# Altium project RK3566_.PrjPcb (part 1 of 6)
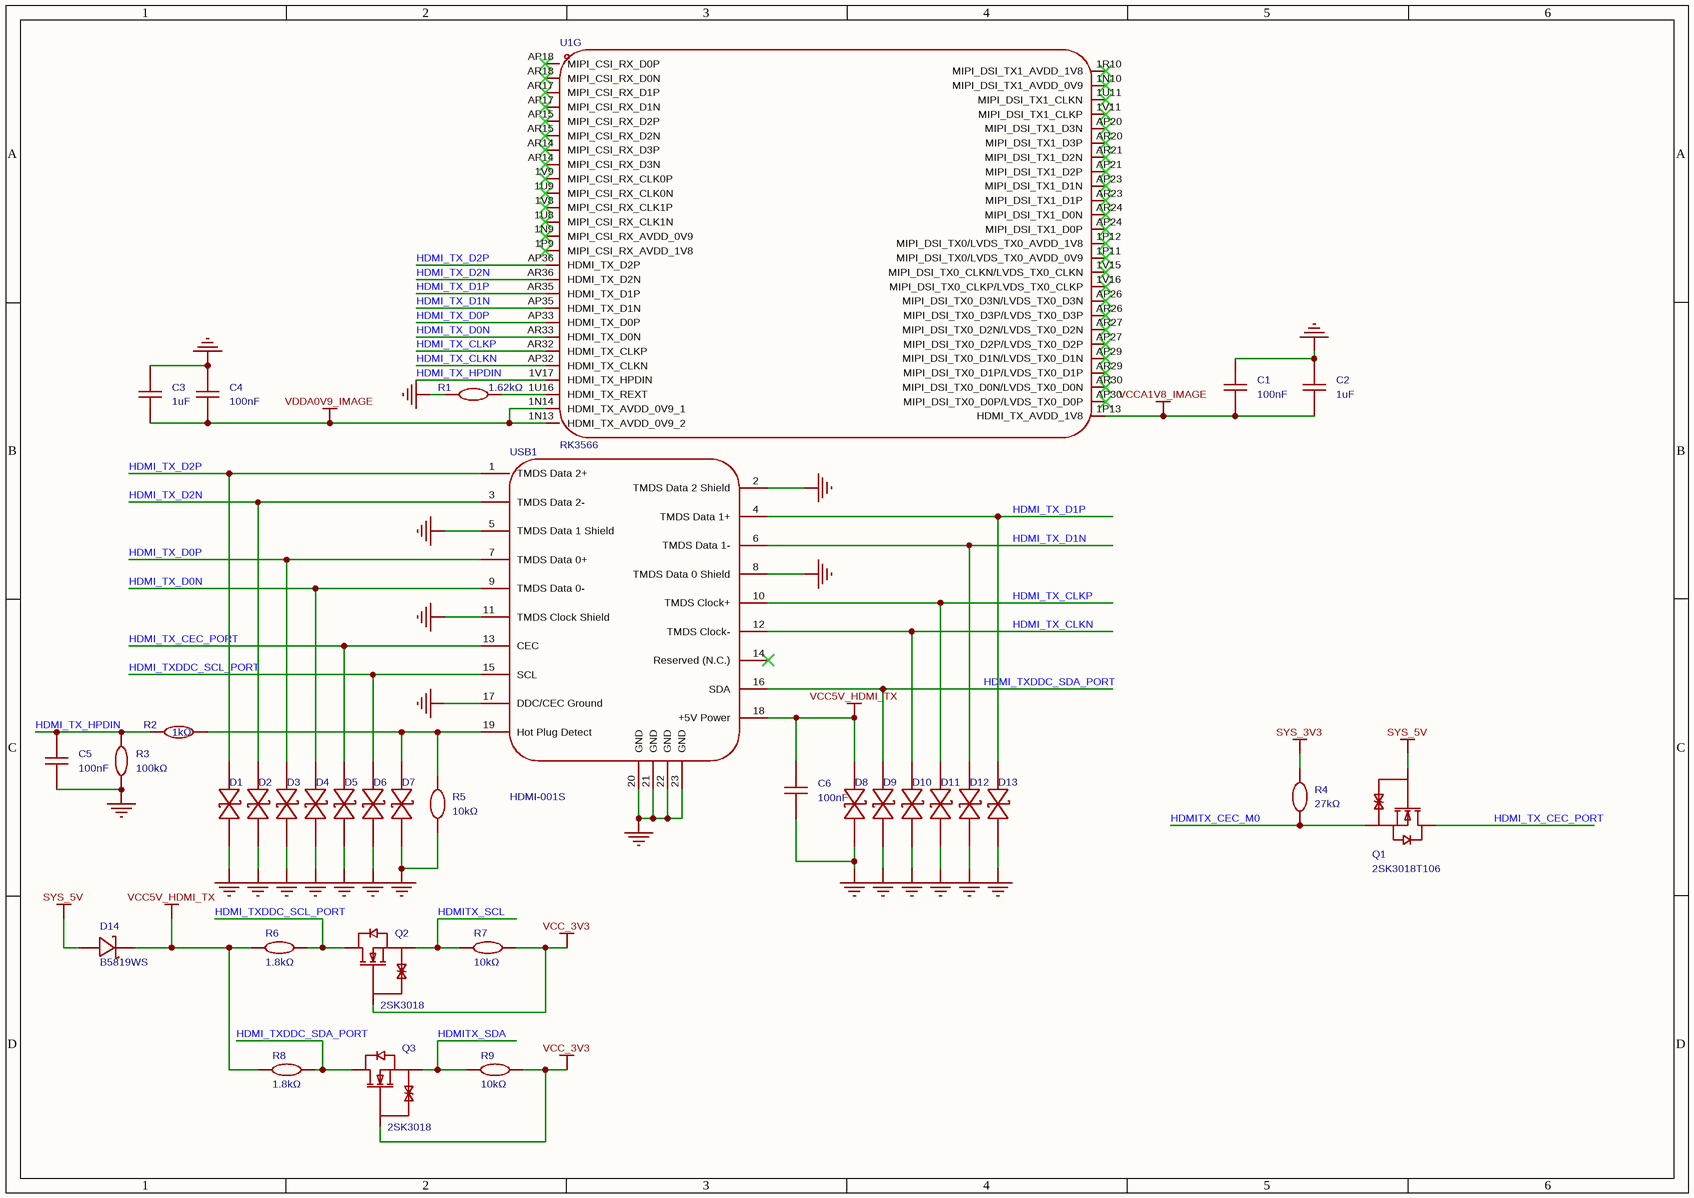
[diagram p0: HDMI PHY _ IO1.schdoc]
11 sheets, 411 parts. Net scope: global (net labels, ports and power ports of the same name join across sheets).
Board file: PCB1.pcbdoc
Sheets:
  HDMI PHY _ IO1.schdoc
  LPDDR4X PHY_IO.schdoc
  PMUIO _ VCCIO.schdoc
  SD卡 PHY.schdoc
  USB接口 PHY_IO.schdoc
  WIFI_BT PHY.schdoc
  板载电源.schdoc
  串口 PHY.schdoc
  扬声器_麦克风.schdoc
  以太网 PHY_以太网_WIFIBT IO.schdoc
  引出引脚_螺纹孔.schdoc

## Sheet HDMI PHY _ IO1.schdoc
size 297 x 209 mm; Symbol: Drawing-Symbol_A4; Company: 嘉立创EDA; Version: V1.0; Page Size: A4; @Project Name: RK3566; @Update Date: 2026-06-03; @Create Date: 2026-05-19; Device: Drawing-Symbol_A4; @Board Name: Board1; @Page Name: P2; @Create Time: 03:19:25; @Page Count: 8; @Page No: 8; @Schematic Name: Schematic1; @Update Time: 03:19:25; @Assembly Variant: Basic; Border: 1; Title Block Position: 3; Size: A4; Width: 1170; Height: 825; Region Start: 1; X Region Count: 6; Y Region Count: 4; Blade Width: 10; SheetNumber: 1; SheetTotal: 11

### Parts
C1  100nF  [C0402]
C2  1uF  [C0402]
C3  1uF  [C0402]
C4  100nF  [C0402]
C5  100nF  [C0402]
C6  100nF  [C0402]
D1  BDFN1C051R  [DFN0603-D_L0.6-W0.3-P0.34-BI]  (value not drawn)
D2  BDFN1C051R  [DFN0603-D_L0.6-W0.3-P0.34-BI]  (value not drawn)
D3  BDFN1C051R  [DFN0603-D_L0.6-W0.3-P0.34-BI]  (value not drawn)
D4  BDFN1C051R  [DFN0603-D_L0.6-W0.3-P0.34-BI]  (value not drawn)
D5  BDFN1C051R  [DFN0603-D_L0.6-W0.3-P0.34-BI]  (value not drawn)
D6  BDFN1C051R  [DFN0603-D_L0.6-W0.3-P0.34-BI]  (value not drawn)
D7  BDFN1C051R  [DFN0603-D_L0.6-W0.3-P0.34-BI]  (value not drawn)
D8  BDFN1C051R  [DFN0603-D_L0.6-W0.3-P0.34-BI]  (value not drawn)
D9  BDFN1C051R  [DFN0603-D_L0.6-W0.3-P0.34-BI]  (value not drawn)
D10  BDFN1C051R  [DFN0603-D_L0.6-W0.3-P0.34-BI]  (value not drawn)
D11  BDFN1C051R  [DFN0603-D_L0.6-W0.3-P0.34-BI]  (value not drawn)
D12  BDFN1C051R  [DFN0603-D_L0.6-W0.3-P0.34-BI]  (value not drawn)
D13  BDFN1C051R  [DFN0603-D_L0.6-W0.3-P0.34-BI]  (value not drawn)
D14  B5819WS  [SOD-323_L1.8-W1.3-LS2.5-RD]
Q1  2SK3018T106  [SOT-323_L2.0-W1.3-P1.30-LS2.1-TR]
Q2  2SK3018  [SOT-323-3_L2.0-W1.3-P1.30-LS2.1-BR]
Q3  2SK3018  [SOT-323-3_L2.0-W1.3-P1.30-LS2.1-BR]
R1  1.62kΩ  [R0402]
R2  1kΩ  [R0402]
R3  100kΩ  [R0402]
R4  27kΩ  [R0402]
R5  10kΩ  [R0402]
R6  1.8kΩ  [R0402]
R7  10kΩ  [R0402]
R8  1.8kΩ  [R0402]
R9  10kΩ  [R0402]
U1  RK3566  [BGA-565_L15.5-W14.4-P0.40_RK3566_1]  (part G of 8)
USB1  HDMI-001S  [HDMI-SMD_HDMI-001S]

### Nets
GND: C1.2 C2.2 C3.2 C4.2 C5.2 C6.2 D1.1 D2.1 D3.1 D4.1 D5.1 D6.1 D7.1 D8.1 D9.1 D10.1 D11.1 D12.1 D13.1 R1.2 R3.1 R5.1 USB1.2(TMDS_Data_2_Shield) USB1.5(TMDS_Data_1_Shield) USB1.8(TMDS_Data_0_Shield) USB1.11(TMDS_Clock_Shield) USB1.17(DDC/CEC_Ground) USB1.20(GND) USB1.21(GND) USB1.22(GND) USB1.23(GND)  [project net AVSS1_1]
SYS_3V3: R4.2
SYS_5V: D14.2(A) Q1.2(G)
VCC5V_HDMI_TX: C6.1 D8.2 D14.1(K) R6.1 R8.1 USB1.18(+5V_Power)
VCC_3V3: Q2.1(G) Q3.1(G) R7.1 R9.1  [project net SWOUT1]
VCCA1V8_IMAGE: C1.1 C2.1 U1.1P13(HDMI_TX_AVDD_1V8)  [project net LDO9]
VDDA0V9_IMAGE: C3.1 C4.1 U1.1N13(HDMI_TX_AVDD_0V9_2) U1.1N14(HDMI_TX_AVDD_0V9_1)  [project net LDO1]
HDMI_TX_CEC_PORT: D5.2 Q1.3(D) USB1.13(CEC)
HDMI_TX_CLKN: D10.2 U1.AP32(HDMI_TX_CLKN) USB1.12(TMDS_Clock-)
HDMI_TX_CLKP: D11.2 U1.AR32(HDMI_TX_CLKP) USB1.10(TMDS_Clock+)
HDMI_TX_D0N: D4.2 U1.AR33(HDMI_TX_D0N) USB1.9(TMDS_Data_0-)
HDMI_TX_D0P: D3.2 U1.AP33(HDMI_TX_D0P) USB1.7(TMDS_Data_0+)
HDMI_TX_D1N: D12.2 U1.AP35(HDMI_TX_D1N) USB1.6(TMDS_Data_1-)
HDMI_TX_D1P: D13.2 U1.AR35(HDMI_TX_D1P) USB1.4(TMDS_Data_1+)
HDMI_TX_D2N: D2.2 U1.AR36(HDMI_TX_D2N) USB1.3(TMDS_Data_2-)
HDMI_TX_D2P: D1.2 U1.AP36(HDMI_TX_D2P) USB1.1(TMDS_Data_2+)
HDMI_TX_HPDIN: C5.1 R2.2 R3.2 U1.1V17(HDMI_TX_HPDIN)
HDMI_TXDDC_SCL_PORT: D6.2 Q2.3(D) R6.2 USB1.15(SCL)
HDMI_TXDDC_SDA_PORT: D9.2 Q3.3(D) R8.2 USB1.16(SDA)
HDMITX_CEC_M0: Q1.1(S) R4.1
HDMITX_SCL: Q2.2(S) R7.2
HDMITX_SDA: Q3.2(S) R9.2
NetD7_2: D7.2 R2.1 R5.2 USB1.19(Hot_Plug_Detect)
NetR1_1: R1.1 U1.1U16(HDMI_TX_REXT)

Not connected (* = marked no-connect by the designer): U1 1N9(MIPI_CSI_RX_AVDD_0V9)* 1N10(MIPI_DSI_TX1_AVDD_0V9)* 1P9(MIPI_CSI_RX_AVDD_1V8)* 1P11(MIPI_DSI_TX0/LVDS_TX0_AVDD_0V9)* 1P12(MIPI_DSI_TX0/LVDS_TX0_AVDD_1V8)* 1R10(MIPI_DSI_TX1_AVDD_1V8)* 1U8(MIPI_CSI_RX_CLK1N)* 1U9(MIPI_CSI_RX_CLK0N)* 1U11(MIPI_DSI_TX1_CLKN)* 1V8(MIPI_CSI_RX_CLK1P)* 1V9(MIPI_CSI_RX_CLK0P)* 1V11(MIPI_DSI_TX1_CLKP)* 1V15(MIPI_DSI_TX0_CLKN/LVDS_TX0_CLKN)* 1V16(MIPI_DSI_TX0_CLKP/LVDS_TX0_CLKP)* AP14(MIPI_CSI_RX_D3N)* AP15(MIPI_CSI_RX_D2P)* AP17(MIPI_CSI_RX_D1N)* AP18(MIPI_CSI_RX_D0P)* AP20(MIPI_DSI_TX1_D3N)* AP21(MIPI_DSI_TX1_D2P)* AP23(MIPI_DSI_TX1_D1N)* AP24(MIPI_DSI_TX1_D0P)* AP26(MIPI_DSI_TX0_D3N/LVDS_TX0_D3N)* AP27(MIPI_DSI_TX0_D2P/LVDS_TX0_D2P)* AP29(MIPI_DSI_TX0_D1N/LVDS_TX0_D1N)* AP30(MIPI_DSI_TX0_D0P/LVDS_TX0_D0P)* AR14(MIPI_CSI_RX_D3P)* AR15(MIPI_CSI_RX_D2N)* AR17(MIPI_CSI_RX_D1P)* AR18(MIPI_CSI_RX_D0N)* AR20(MIPI_DSI_TX1_D3P)* AR21(MIPI_DSI_TX1_D2N)* AR23(MIPI_DSI_TX1_D1P)* AR24(MIPI_DSI_TX1_D0N)* AR26(MIPI_DSI_TX0_D3P/LVDS_TX0_D3P)* AR27(MIPI_DSI_TX0_D2N/LVDS_TX0_D2N)* AR29(MIPI_DSI_TX0_D1P/LVDS_TX0_D1P)* AR30(MIPI_DSI_TX0_D0N/LVDS_TX0_D0N)*; USB1 14(Reserved_(N.C.))*

### Notes on the sheet
- 创建日期
- 2026-10-04
- 原理图
- 板子
- Schematic1
- Board1
- 更新日期
- 图页
- P2
- 绘制
- 审阅
- RK3566
- 版本
- V1.0
- 尺寸
- A4
- 页    8    共    8
- 嘉立创EDA

### Library data of the parts
C1 C4-C6 = CL05B104KO5NNNC: 容值:100nF;精度:±10%;额定电压:16V;温度系数:X7R;; Manufacturer: SAMSUNG(三星); 3D Model: 36a51122f27c49738f86b3bfa98863e0聨0819f05c4eef4c71ace90d822a990e87; 3D Model Transform: 39.37,19.685,0,0,0,0,0,0,0; Tolerance: ±10%; Voltage Rating: 16V; Temperature Coefficient: X7R; AddInBom: yes; ModelName: C0402_L1.0-W0.5-H0.5; Symbol: CL05B104KO5NNNC; Device: CL05B104KO5NNNC; LCSC Part Name: 100nF ±10% 16V; Supplier Part: C1525; Manufacturer Part: CL05B104KO5NNNC; Supplier Footprint: 0402; JLCPCB Part Class: Basic Part; Datasheet: https://item.szlcsc.com/datasheet/CL05B104KO5NNNC/1877.html; Supplier: LCSC; Value: 100nF; ConvertToPcb: yes; FootprintName: C0402
C2 C3 = HGC0402R5105K500NTEJ: 容值:1uF;精度:±10%;额定电压:50V;温度系数:X5R;; Manufacturer: Chinocera(华瓷); 3D Model: 36a51122f27c49738f86b3bfa98863e0聨0819f05c4eef4c71ace90d822a990e87; 3D Model Transform: 39.37,19.685,0,0,0,0,0,0,0; Tolerance: ±10%; Voltage Rating: 50V; Temperature Coefficient: X5R; AddInBom: yes; ModelName: C0402_L1.0-W0.5-H0.5; Symbol: HGC0402R5105K500NTEJ; Device: HGC0402R5105K500NTEJ; LCSC Part Name: 1uF ±10% 50V; Supplier Part: C7472948; Manufacturer Part: HGC0402R5105K500NTEJ; Supplier Footprint: 0402; JLCPCB Part Class: Extended Part; Datasheet: https://item.szlcsc.com/datasheet/HGC0402R5105K500NTEJ/8532795.html; Supplier: LCSC; Value: 1uF; ConvertToPcb: yes; FootprintName: C0402
D1-D13 = BDFN1C051R: 极性:双向;反向截止电压(Vrwm):5V;钳位电压:13V;峰值脉冲电流(Ipp):4A@8/20us;击穿电压(VBR):5.5V;; Manufacturer: BORN(伯恩半导体); AddInBom: yes; ModelId: 295ccb0e91f84fca9fcc42e8f031306b聨0819f05c4eef4c71ace90d822a990e87; ModelName: DFN0603-D_L0.6-W0.3--H0.3-P0.34-BI; ModelTransform: 24.0157,12.2047,0,0,0,0,0,0,0; Polarity: 双向; Reverse Stand-Off Voltage (Vrwm): 5V; Clamping Voltage: 13V; Voltage - Breakdown: 5.5V; Reverse Leakage Current (Ir): 100nA; Number of Channels: 单路; level of protection: IEC 61000-4-4；IEC 61000-4-5；IEC 61000-4-2; Type: ESD; Junction Capacitance: 0.2pF; Symbol: BDFN1C051R; Device: BDFN1C051R; LCSC Part Name: 双向ESD 5V截止 峰值脉冲电流：4A@8/20us; SupplierPart: C152032; ManufacturerPart: BDFN1C051R; Supplier Footprint: DFN0603-D; JLCPCB Part Class: Extended Part; Datasheet: https://item.szlcsc.com/datasheet/BDFN1C051R/163372.html; Supplier: LCSC; ConvertToPcb: yes; FootprintName: DFN0603-D_L0.6-W0.3-P0.34-BI; Peak Pulse Current (Ipp): 4A@8/20us
D14 = B5819WS_C22624: 直流反向耐压(Vr):40V;平均整流电流(Io):1A;正向压降(Vf):600mV@1A;; Manufacturer: CJ(江苏长电/长晶); 3D Model: e9dd044ee7bf4221b3b795eb56bce7c0; 3D Model Transform: 98.91933,51.181,0,180,0,0,0.985,-0.0005,0; Reverse Voltage (Vr): 40V; Average Rectified Current (Io): 1A; AddInBom: yes; ModelName: SOD-323_L1.7-W1.3-H1.1-LS2.5; Symbol: B5819WS_C22624; Device: B5819WS_C22624; LCSC Part Name: 40V 1A 600mV@1A; Supplier Part: C22624; Manufacturer Part: B5819WS; Supplier Footprint: SOD-323; JLCPCB Part Class: Extended Part; Datasheet: https://atta.szlcsc.com/upload/public/pdf/source/20170919/C22624_1505799673448977596.pdf; Supplier: LCSC; Forward Voltage (Vf@If): 600mV@1A; ConvertToPcb: yes; FootprintName: SOD-323_L1.8-W1.3-LS2.5-RD
Q1 = 2SK3018T106: 数量:1个N沟道;漏源电压(Vdss):30V;连续漏极电流(Id):100mA;导通电阻(RDS(on)):13Ω@2.5V;耗散功率(Pd):200mW;阈值电压(Vgs(th)):1.5V;; Manufacturer: ROHM(罗姆); AddInBom: yes; ModelId: 16cdee8f029a4e608a375d4e8ff80303聨0819f05c4eef4c71ace90d822a990e87; ModelTransform: 82.677,78.74,0,0,0,0,0,0,0; Number: 1个N沟道; Drain to Source Voltage: 30V; Current - Continuous Drain(Id): 100mA; Pd - Power Dissipation: 200mW; Gate Threshold Voltage (Vgs(th)): 1.5V; Input Capacitance(Ciss): 13pF; Reverse Transfer Capacitance (Crss@Vds): 4pF; Type: N沟道; Output Capacitance(Coss): 9pF; Vgs: ±20V; Symbol: 2SK3018T106; Device: 2SK3018T106; LCSC Part Name: 1个N沟道 耐压:30V 电流:100mA; SupplierPart: C113315; ManufacturerPart: 2SK3018T106; Supplier Footprint: SOT-323; JLCPCB Part Class: Extended Part; Datasheet: https://item.szlcsc.com/datasheet/2SK3018T106/114550.html; Supplier: LCSC; ConvertToPcb: yes; FootprintName: SOT-323_L2.0-W1.3-P1.30-LS2.1-TR; ModelName: SOT-323_L2.0-W1.3-P1.30-LS2.1-TR; RDS(on): 13Ω@2.5V; Gate Charge(Qg): -; Operating Temperature: -55℃~+150℃; Configuration: -
Q2 Q3 = 2SK3018_C194460: 类型:N沟道;漏源电压(Vdss):30V;连续漏极电流(Id):100mA;功率(Pd):200mW;导通电阻(RDS(on)@Vgs,Id):8Ω@4V,10mA;阈值电压(Vgs(th)@Id):1.5V@100uA;; Manufacturer: CJ(江苏长电/长晶); 3D Model: 59529c0d6fc749f28f2d0659e12986b4; 3D Model Transform: 78.74,82.677,0,90,0,0,0.0005,0,0; Type: N沟道; Drain Source Voltage (Vdss): 30V; Continuous Drain Current (Id): 100mA; Power Dissipation (Pd): 200mW; AddInBom: yes; ModelName: SOT-323-3_L2.0-W1.3-H1.0-LS2.1-P1.30; Symbol: 2SK3018_C194460; Device: 2SK3018_C194460; LCSC Part Name: N沟道 30V 100mA; Supplier Part: C194460; Manufacturer Part: 2SK3018; Supplier Footprint: SOT-323-3; JLCPCB Part Class: Extended Part; Datasheet: https://atta.szlcsc.com/upload/public/pdf/source/20180612/C194460_7DCC01674DB4E554C67F4CC0517F82F1.pdf; Supplier: LCSC; Drain Source On Resistance (RDS(on)@Vgs,Id): 8Ω@4V,10mA; Gate Threshold Voltage (Vgs(th)@Id): 1.5V@100uA; ConvertToPcb: yes; FootprintName: SOT-323-3_L2.0-W1.3-P1.30-LS2.1-BR
R1 = RC0402FR-071K62L: 最大工作电压:50V;工作温度范围:-55℃~+155℃;电阻长:-;精度:±1%;电阻直径:-;电阻高:-;电阻宽:-;电阻类型:厚膜电阻;功率:62.5mW;温度系数:±100ppm/℃;阻值:1.62kΩ;; Manufacturer: YAGEO(国巨); Symbol: RC-02W1621FT; 3D Model: 671aefced39d4c318694bba8bd8efd39; 3D Model Transform: 39.37,19.685,0,0,0,0,0,0.0005,0; Overload Voltage (Max): 50V; Tolerance: ±1%; Power(Watts): 62.5mW; AddInBom: yes; ModelName: R0402_L1.0-W0.5-H0.5; Device: RC0402FR-071K62L; Datasheet: https://atta.szlcsc.com/upload/public/pdf/source/20181114/C321323_9504FB1C8D32FD153B2A6FEF9347E3A6.pdf; LCSC Part Name: 1.62kΩ ±1%; Supplier Part: C138038; Manufacturer Part: RC0402FR-071K62L; Supplier Footprint: 0402; JLCPCB Part Class: Extended Part; Supplier: LCSC; Operating Temperature Range: -55℃~+155℃; Body Length: -; φD: -; Body Height: -; Body Width: -; Type: 厚膜电阻; Temperature Coefficient: ±100ppm/℃; Value: 1.62kΩ; ConvertToPcb: yes; FootprintName: R0402
R2 = 0402WGF1001TCE: 电阻类型:厚膜电阻;阻值:1kΩ;精度:±1%;功率:62.5mW;温度系数:±100ppm/℃;最大工作电压:50V;工作温度范围:-55℃~+155℃;; Manufacturer: UNI-ROYAL(厚声); 3D Model: 671aefced39d4c318694bba8bd8efd39; 3D Model Transform: 39.37,19.685,0,0,0,0,0,0.0005,0; Tolerance: ±1%; Power(Watts): 62.5mW; Overload Voltage (Max): 50V; AddInBom: yes; ModelName: R0402_L1.0-W0.5-H0.5; Symbol: 0402WGF1001TCE; Device: 0402WGF1001TCE; LCSC Part Name: 1kΩ ±1% 62.5mW; Supplier Part: C11702; Manufacturer Part: 0402WGF1001TCE; Supplier Footprint: 0402; JLCPCB Part Class: Basic Part; Datasheet: https://atta.szlcsc.com/upload/public/pdf/source/20200306/C422600_1E6D84923E4A46A82E41ADD87F860B5C.pdf; Supplier: LCSC; Type: 厚膜电阻; Value: 1kΩ; Temperature Coefficient: ±100ppm/℃; Operating Temperature Range: -55℃~+155℃; ConvertToPcb: yes; FootprintName: R0402
R3 = 0402WGF1003TCE: 电阻类型:厚膜电阻;阻值:100kΩ;精度:±1%;功率:62.5mW;温度系数:±100ppm/℃;最大工作电压:50V;工作温度范围:-55℃~+155℃;; Manufacturer: UNI-ROYAL(厚声); 3D Model: 671aefced39d4c318694bba8bd8efd39; 3D Model Transform: 39.37,19.685,0,0,0,0,0,0.0005,0; Tolerance: ±1%; Power(Watts): 62.5mW; Overload Voltage (Max): 50V; AddInBom: yes; ModelName: R0402_L1.0-W0.5-H0.5; Symbol: 0402WGF1003TCE; Device: 0402WGF1003TCE; LCSC Part Name: 100kΩ ±1% 62.5mW; Supplier Part: C25741; Manufacturer Part: 0402WGF1003TCE; Supplier Footprint: 0402; JLCPCB Part Class: Basic Part; Datasheet: https://atta.szlcsc.com/upload/public/pdf/source/20200306/C422600_1E6D84923E4A46A82E41ADD87F860B5C.pdf; Supplier: LCSC; Type: 厚膜电阻; Value: 100kΩ; Temperature Coefficient: ±100ppm/℃; Operating Temperature Range: -55℃~+155℃; Voltage-Supply(Max): 50V; Operating Temperature: -55℃~+155℃; ConvertToPcb: yes; FootprintName: R0402
R4 = FRC0402F2702TS: 电阻类型:厚膜电阻;阻值:27kΩ;精度:±1%;功率:62.5mW;工作电压:50V;温度系数:±100ppm/℃;; Manufacturer: FOJAN(富捷); AddInBom: yes; ModelId: 98c88bc2b9094f218f3a3e30a7012738聨0819f05c4eef4c71ace90d822a990e87; ModelName: R0402_L1.0-W0.5-H0.4; ModelTransform: 39.37,19.685,0,0,0,0,0,0,0; Tolerance: ±1%; Power(Watts): 62.5mW; Voltage-Supply(Max): 50V; Symbol: FRC0402F2702TS; Device: FRC0402F2702TS; LCSC Part Name: 27kΩ ±1% 62.5mW 厚膜电阻; SupplierPart: C2933084; ManufacturerPart: FRC0402F2702TS; Supplier Footprint: 0402; JLCPCB Part Class: Extended Part; Datasheet: https://item.szlcsc.com/datasheet/FRC0402F2702TS/3279186.html; Supplier: LCSC; ConvertToPcb: yes; FootprintName: R0402; Type: 厚膜电阻; Value: 27kΩ; Temperature Coefficient: ±100ppm/℃; Operating Temperature: -55℃~+155℃
R5 = FRC0402F1002TS: 电阻类型:厚膜电阻;阻值:10kΩ;精度:±1%;功率:62.5mW;工作电压:50V;温度系数:±100ppm/℃;; Manufacturer: FOJAN(富捷); 3D Model: 98c88bc2b9094f218f3a3e30a7012738聨0819f05c4eef4c71ace90d822a990e87; 3D Model Transform: 39.37,19.685,0,0,0,0,0,0,0; Tolerance: ±1%; Power(Watts): 62.5mW; Voltage-Supply(Max): 50V; AddInBom: yes; ModelName: R0402_L1.0-W0.5-H0.4; Symbol: FRC0402F1002TS; Device: FRC0402F1002TS; LCSC Part Name: 10kΩ ±1% 62.5mW 厚膜电阻; Supplier Part: C2906861; Manufacturer Part: FRC0402F1002TS; Supplier Footprint: 0402; JLCPCB Part Class: Extended Part; Datasheet: https://item.szlcsc.com/datasheet/FRC0402F1002TS/3180374.html; Supplier: LCSC; Type: 厚膜电阻; Value: 10kΩ; Temperature Coefficient: ±100ppm/℃; Operating Temperature: -55℃~+155℃; ConvertToPcb: yes; FootprintName: R0402
R6 R8 = RC0402FR-071K8L: 电阻类型:厚膜电阻;阻值:1.8kΩ;精度:±1%;功率:62.5mW;温度系数:±100ppm/℃;最大工作电压:50V;工作温度范围:-55℃~+155℃;; Manufacturer: YAGEO(国巨); 3D Model: 671aefced39d4c318694bba8bd8efd39; 3D Model Transform: 39.37,19.685,0,0,0,0,0,0.0005,0; Tolerance: ±1%; Power(Watts): 62.5mW; Overload Voltage (Max): 50V; AddInBom: yes; ModelName: R0402_L1.0-W0.5-H0.5; Symbol: RC0402FR-071K8L; Device: RC0402FR-071K8L; LCSC Part Name: 1.8kΩ ±1% 62.5mW; Supplier Part: C163481; Manufacturer Part: RC0402FR-071K8L; Supplier Footprint: 0402; JLCPCB Part Class: Extended Part; Datasheet: https://atta.szlcsc.com/upload/public/pdf/source/20180111/C163481_15156544709981259002.pdf; Supplier: LCSC; Type: 厚膜电阻; Value: 1.8kΩ; Temperature Coefficient: ±100ppm/℃; Operating Temperature Range: -55℃~+155℃; ConvertToPcb: yes; FootprintName: R0402
R7 R9 = CRCW040210K0FKED: 电阻类型:厚膜电阻;阻值:10kΩ;精度:±1%;功率:63mW;温度系数:±100ppm/K;最大工作电压:50V;工作温度范围:-55℃~+155℃;; Manufacturer: VISHAY(威世); 3D Model: 671aefced39d4c318694bba8bd8efd39; 3D Model Transform: 39.37,19.685,0,0,0,0,0,0.0005,0; Tolerance: ±1%; Power(Watts): 63mW; Overload Voltage (Max): 50V; AddInBom: yes; ModelName: R0402_L1.0-W0.5-H0.5; Symbol: CRCW040210K0FKED; Device: CRCW040210K0FKED; LCSC Part Name: 10kΩ ±1% 63mW; Supplier Part: C71617; Manufacturer Part: CRCW040210K0FKED; Supplier Footprint: 0402; JLCPCB Part Class: 扩展库; Datasheet: https://atta.szlcsc.com/upload/public/pdf/source/20180224/C71617_15194370300791364062.pdf; Supplier: LCSC; Type: 厚膜电阻; Value: 10kΩ; Temperature Coefficient: ±100ppm/K; Operating Temperature Range: -55℃~+155℃; ConvertToPcb: yes; FootprintName: R0402
U1 = RK3566: 是一款高性能、低功耗的四核应用处理器，专为个人移动互联网设备和AIoT设备设计。提供了许多嵌入式强大硬件引擎，以优化高端应用的性能。支持几乎全格式的H.264 4K@60fps解码器、H.265 4K@60fps解码器，还支持H.264/H.265 1080p@60fps编码器、高质量JPEG编码器/解码器。嵌入式3D GPU使其完全兼容OpenGL ES 1.1/2.0/3.2、OpenCL 2.0和Vulkan 1.1; Manufacturer: Rockchip(瑞芯微); Relevance: []; 3D Model: 096be4498db445d8b521581a084e15ec聨0819f05c4eef4c71ace90d822a990e87; 3D Model Transform: 610.235,566.928,0,0,0,0,0,0,0; AddInBom: yes; Symbol: RK3566; Device: RK3566; LCSC Part Name: 表面贴装型开关全行程、动作力等性能; Supplier Part: C2943786; Manufacturer Part: RK3566; Supplier Footprint: BGA-565(15.5x14.4); JLCPCB Part Class: Extended Part; Datasheet: https://item.szlcsc.com/datasheet/RK3566/3329057.html; Supplier: LCSC; ConvertToPcb: yes; FootprintName: BGA-565_L15.5-W14.4-P0.40_RK3566_1; ModelName: BGA-565_L15.5-W14.4-P0.40_RK3566_1
USB1 = HDMI-001S: 19PIN A型前插后贴HDMI插座 铜壳; Manufacturer: XUNPU(讯普); AddInBom: yes; ModelId: 95350f9f774e4f059b8c605506db97f9聨0819f05c4eef4c71ace90d822a990e87; ModelTransform: 590.5878,468.503,0,0,0,0,0,-79.567,-85.039; Connector Type: HDMI-A; Gender: 母; Symbol: HDMI-001S; Device: HDMI-001S; LCSC Part Name: HDMI-A 母 19P; SupplierPart: C720616; ManufacturerPart: HDMI-001S; Supplier Footprint: SMD; JLCPCB Part Class: Extended Part; Datasheet: https://item.szlcsc.com/datasheet/HDMI-001S/763623.html; Supplier: LCSC; ConvertToPcb: yes; FootprintName: HDMI-SMD_HDMI-001S; ModelName: HDMI-SMD_HDMI-001S; Number of Pins: 19P; Mounting Type: 卧贴; Current Rating: -; Voltage Rating: -; Operating Temperature: -

## Sheet LPDDR4X PHY_IO.schdoc
size 420 x 297 mm; Symbol: Drawing-Symbol_A4; Company: 嘉立创EDA; Version: V1.0; Page Size: A4; @Project Name: RK3566; @Update Date: 2026-10-04; @Create Date: 2026-05-19; Device: Drawing-Symbol_A4; @Board Name: Board1; @Page Name: P2; @Create Time: 03:18:35; @Page Count: 6; @Page No: 6; @Schematic Name: Schematic1; @Update Time: 03:18:35; @Assembly Variant: Basic; Border: 1; Title Block Position: 3; Size: A4; Width: 1655; Height: 1170; Region Start: 1; X Region Count: 6; Y Region Count: 4; Blade Width: 10; SheetNumber: 2; SheetTotal: 11
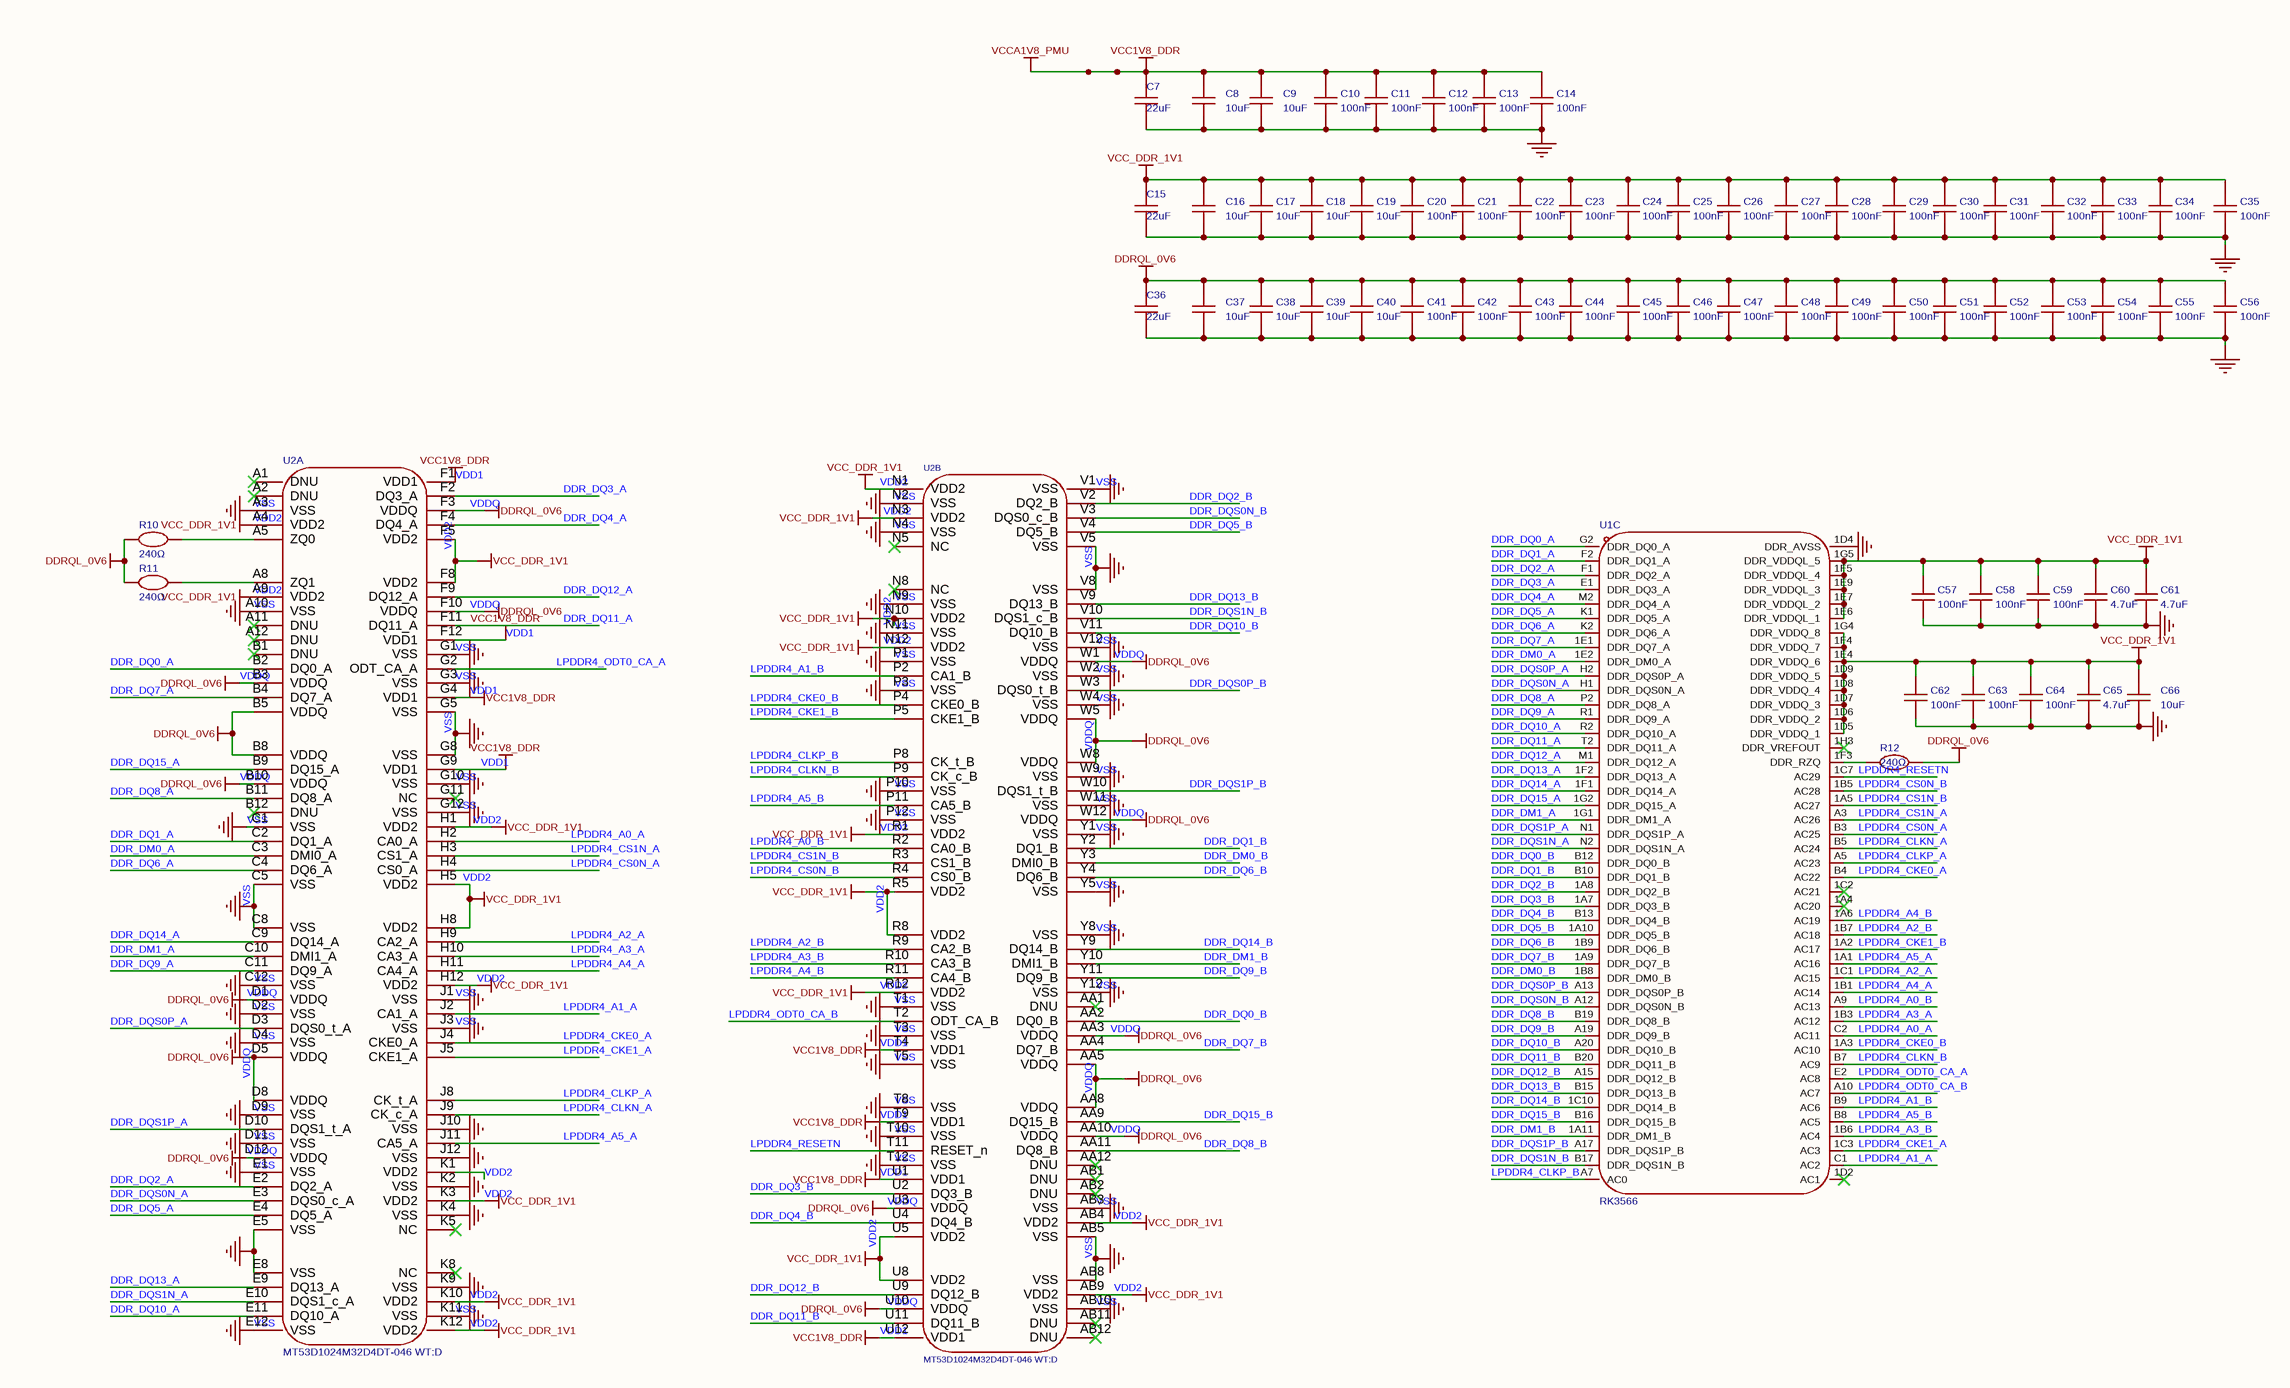
[diagram p1: LPDDR4X PHY_IO.schdoc]

### Parts
C7  22uF  [C0603]
C8  10uF  [C0402]
C9  10uF  [C0402]
C10  100nF  [C0402]
C11  100nF  [C0402]
C12  100nF  [C0402]
C13  100nF  [C0402]
C14  100nF  [C0402]
C15  22uF  [C0603]
C16  10uF  [C0402]
C17  10uF  [C0402]
C18  10uF  [C0402]
C19  10uF  [C0402]
C20  100nF  [C0402]
C21  100nF  [C0402]
C22  100nF  [C0402]
C23  100nF  [C0402]
C24  100nF  [C0402]
C25  100nF  [C0402]
C26  100nF  [C0402]
C27  100nF  [C0402]
C28  100nF  [C0402]
C29  100nF  [C0402]
C30  100nF  [C0402]
C31  100nF  [C0402]
C32  100nF  [C0402]
C33  100nF  [C0402]
C34  100nF  [C0402]
C35  100nF  [C0402]
C36  22uF  [C0603]
C37  10uF  [C0402]
C38  10uF  [C0402]
C39  10uF  [C0402]
C40  10uF  [C0402]
C41  100nF  [C0402]
C42  100nF  [C0402]
C43  100nF  [C0402]
C44  100nF  [C0402]
C45  100nF  [C0402]
C46  100nF  [C0402]
C47  100nF  [C0402]
C48  100nF  [C0402]
C49  100nF  [C0402]
C50  100nF  [C0402]
C51  100nF  [C0402]
C52  100nF  [C0402]
C53  100nF  [C0402]
C54  100nF  [C0402]
C55  100nF  [C0402]
C56  100nF  [C0402]
C57  100nF  [C0201]
C58  100nF  [C0201]
C59  100nF  [C0201]
C60  4.7uF  [C0402]
C61  4.7uF  [C0402]
C62  100nF  [C0201]
C63  100nF  [C0201]
C64  100nF  [C0201]
C65  4.7uF  [C0402]
C66  10uF  [C0603]
R10  240Ω  [R0402]
R11  240Ω  [R0402]
R12  240Ω  [R0402]
U1  RK3566  [BGA-565_L15.5-W14.4-P0.40_RK3566_1]  (part C of 8)
U2  MT53D1024M32D4DT-046 WT:D  [VFBGA-200_L14.5-W10.0-BL_MT53D1024M32D4DT]  (parts A,B of 2)

### Nets
GND: C7.1 C8.1 C9.1 C10.1 C11.1 C12.1 C13.1 C14.1 C15.1 C16.1 C17.1 C18.1 C19.1 C20.1 C21.1 C22.1 C23.1 C24.1 C25.1 C26.1 C27.1 C28.1 C29.1 C30.1 C31.1 C32.1 C33.1 C34.1 C35.1 C36.1 C37.1 C38.1 C39.1 C40.1 C41.1 C42.1 C43.1 C44.1 C45.1 C46.1 C47.1 C48.1 C49.1 C50.1 C51.1 C52.1 C53.1 C54.1 C55.1 C56.1 C57.1 C58.1 C59.1 C60.1 C61.1 C62.1 C63.1 C64.1 C65.1 C66.1 U1.1D4(DDR_AVSS) U2.A3(VSS) U2.A10(VSS) U2.AB3(VSS) U2.AB5(VSS) U2.AB8(VSS) U2.AB10(VSS) U2.C1(VSS) U2.C5(VSS) U2.C8(VSS) U2.C12(VSS) U2.D2(VSS) U2.D4(VSS) U2.D9(VSS) U2.D11(VSS) U2.E1(VSS) U2.E5(VSS) U2.E8(VSS) U2.E12(VSS) U2.G1(VSS) U2.G3(VSS) U2.G5(VSS) U2.G8(VSS) U2.G10(VSS) U2.G12(VSS) U2.J1(VSS) U2.J3(VSS) U2.J10(VSS) U2.J12(VSS) U2.K2(VSS) U2.K4(VSS) U2.K9(VSS) U2.K11(VSS) U2.N2(VSS) U2.N4(VSS) U2.N9(VSS) U2.N11(VSS) U2.P1(VSS) U2.P3(VSS) U2.P10(VSS) U2.P12(VSS) U2.T1(VSS) U2.T3(VSS) U2.T5(VSS) U2.T8(VSS) U2.T10(VSS) U2.T12(VSS) U2.V1(VSS) U2.V5(VSS) U2.V8(VSS) U2.V12(VSS) U2.W2(VSS) U2.W4(VSS) U2.W9(VSS) U2.W11(VSS) U2.Y1(VSS) U2.Y5(VSS) U2.Y8(VSS) U2.Y12(VSS)  [also labelled VSS]  [project net AVSS1_1]
VCC1V8_DDR: C7.2 C8.2 C9.2 C10.2 C11.2 C12.2 C13.2 C14.2 U2.F1(VDD1) U2.F12(VDD1) U2.G4(VDD1) U2.G9(VDD1) U2.T4(VDD1) U2.T9(VDD1) U2.U1(VDD1) U2.U12(VDD1)  [also labelled VCCA1V8_PMU, VDD1]  [project net LDO8]
VCC_DDR_1V1: C15.2 C16.2 C17.2 C18.2 C19.2 C20.2 C21.2 C22.2 C23.2 C24.2 C25.2 C26.2 C27.2 C28.2 C29.2 C30.2 C31.2 C32.2 C33.2 C34.2 C35.2 C57.2 C58.2 C59.2 C60.2 C61.2 C62.2 C63.2 C64.2 C65.2 C66.2 U1.1D5(DDR_VDDQ_1) U1.1D6(DDR_VDDQ_2) U1.1D7(DDR_VDDQ_3) U1.1D8(DDR_VDDQ_4) U1.1D9(DDR_VDDQ_5) U1.1E4(DDR_VDDQ_6) U1.1E6(DDR_VDDQL_1) U1.1E7(DDR_VDDQL_2) U1.1E9(DDR_VDDQL_3) U1.1F4(DDR_VDDQ_7) U1.1F5(DDR_VDDQL_4) U1.1G4(DDR_VDDQ_8) U1.1G5(DDR_VDDQL_5) U2.A4(VDD2) U2.A9(VDD2) U2.AB4(VDD2) U2.AB9(VDD2) U2.F5(VDD2) U2.F8(VDD2) U2.H1(VDD2) U2.H5(VDD2) U2.H8(VDD2) U2.H12(VDD2) U2.K1(VDD2) U2.K3(VDD2) U2.K10(VDD2) U2.K12(VDD2) U2.N1(VDD2) U2.N3(VDD2) U2.N10(VDD2) U2.N12(VDD2) U2.R1(VDD2) U2.R5(VDD2) U2.R8(VDD2) U2.R12(VDD2) U2.U5(VDD2) U2.U8(VDD2)  [also labelled VDD2]  [project net VBUCK3]
VDDQ: C36.2 C37.2 C38.2 C39.2 C40.2 C41.2 C42.2 C43.2 C44.2 C45.2 C46.2 C47.2 C48.2 C49.2 C50.2 C51.2 C52.2 C53.2 C54.2 C55.2 C56.2 R10.1 R11.1 R12.1 U2.AA3(VDDQ) U2.AA5(VDDQ) U2.AA8(VDDQ) U2.AA10(VDDQ) U2.B3(VDDQ) U2.B5(VDDQ) U2.B8(VDDQ) U2.B10(VDDQ) U2.D1(VDDQ) U2.D5(VDDQ) U2.D8(VDDQ) U2.D12(VDDQ) U2.F3(VDDQ) U2.F10(VDDQ) U2.U3(VDDQ) U2.U10(VDDQ) U2.W1(VDDQ) U2.W5(VDDQ) U2.W8(VDDQ) U2.W12(VDDQ)  [also labelled DDRQL_0V6]
DDR_DM0_A: U1.1E2(DDR_DM0_A) U2.C3(DMI0_A)
DDR_DM0_B: U1.1B8(DDR_DM0_B) U2.Y3(DMI0_B)
DDR_DM1_A: U1.1G1(DDR_DM1_A) U2.C10(DMI1_A)
DDR_DM1_B: U1.1A11(DDR_DM1_B) U2.Y10(DMI1_B)
DDR_DQ0_A: U1.G2(DDR_DQ0_A) U2.B2(DQ0_A)
DDR_DQ0_B: U1.B12(DDR_DQ0_B) U2.AA2(DQ0_B)
DDR_DQ1_A: U1.F2(DDR_DQ1_A) U2.C2(DQ1_A)
DDR_DQ1_B: U1.B10(DDR_DQ1_B) U2.Y2(DQ1_B)
DDR_DQ2_A: U1.F1(DDR_DQ2_A) U2.E2(DQ2_A)
DDR_DQ2_B: U1.1A8(DDR_DQ2_B) U2.V2(DQ2_B)
DDR_DQ3_A: U1.E1(DDR_DQ3_A) U2.F2(DQ3_A)
DDR_DQ3_B: U1.1A7(DDR_DQ3_B) U2.U2(DQ3_B)
DDR_DQ4_A: U1.M2(DDR_DQ4_A) U2.F4(DQ4_A)
DDR_DQ4_B: U1.B13(DDR_DQ4_B) U2.U4(DQ4_B)
DDR_DQ5_A: U1.K1(DDR_DQ5_A) U2.E4(DQ5_A)
DDR_DQ5_B: U1.1A10(DDR_DQ5_B) U2.V4(DQ5_B)
DDR_DQ6_A: U1.K2(DDR_DQ6_A) U2.C4(DQ6_A)
DDR_DQ6_B: U1.1B9(DDR_DQ6_B) U2.Y4(DQ6_B)
DDR_DQ7_A: U1.1E1(DDR_DQ7_A) U2.B4(DQ7_A)
DDR_DQ7_B: U1.1A9(DDR_DQ7_B) U2.AA4(DQ7_B)
DDR_DQ8_A: U1.P2(DDR_DQ8_A) U2.B11(DQ8_A)
DDR_DQ8_B: U1.B19(DDR_DQ8_B) U2.AA11(DQ8_B)
DDR_DQ9_A: U1.R1(DDR_DQ9_A) U2.C11(DQ9_A)
DDR_DQ9_B: U1.A19(DDR_DQ9_B) U2.Y11(DQ9_B)
DDR_DQ10_A: U1.R2(DDR_DQ10_A) U2.E11(DQ10_A)
DDR_DQ10_B: U1.A20(DDR_DQ10_B) U2.V11(DQ10_B)
DDR_DQ11_A: U1.T2(DDR_DQ11_A) U2.F11(DQ11_A)
DDR_DQ11_B: U1.B20(DDR_DQ11_B) U2.U11(DQ11_B)
DDR_DQ12_A: U1.M1(DDR_DQ12_A) U2.F9(DQ12_A)
DDR_DQ12_B: U1.A15(DDR_DQ12_B) U2.U9(DQ12_B)
DDR_DQ13_A: U1.1F2(DDR_DQ13_A) U2.E9(DQ13_A)
DDR_DQ13_B: U1.B15(DDR_DQ13_B) U2.V9(DQ13_B)
DDR_DQ14_A: U1.1F1(DDR_DQ14_A) U2.C9(DQ14_A)
DDR_DQ14_B: U1.1C10(DDR_DQ14_B) U2.Y9(DQ14_B)
DDR_DQ15_A: U1.1G2(DDR_DQ15_A) U2.B9(DQ15_A)
DDR_DQ15_B: U1.B16(DDR_DQ15_B) U2.AA9(DQ15_B)
DDR_DQS0N_A: U1.H1(DDR_DQS0N_A) U2.E3(DQS0_c_A)
DDR_DQS0N_B: U1.A12(DDR_DQS0N_B) U2.V3(DQS0_c_B)
DDR_DQS0P_A: U1.H2(DDR_DQS0P_A) U2.D3(DQS0_t_A)
DDR_DQS0P_B: U1.A13(DDR_DQS0P_B) U2.W3(DQS0_t_B)
DDR_DQS1N_A: U1.N2(DDR_DQS1N_A) U2.E10(DQS1_c_A)
DDR_DQS1N_B: U1.B17(DDR_DQS1N_B) U2.V10(DQS1_c_B)
DDR_DQS1P_A: U1.N1(DDR_DQS1P_A) U2.D10(DQS1_t_A)
DDR_DQS1P_B: U1.A17(DDR_DQS1P_B) U2.W10(DQS1_t_B)
LPDDR4_A0_A: U1.C2(AC11) U2.H2(CA0_A)
LPDDR4_A0_B: U1.A9(AC13) U2.R2(CA0_B)
LPDDR4_A1_A: U1.C1(AC2) U2.J2(CA1_A)
LPDDR4_A1_B: U1.B9(AC6) U2.P2(CA1_B)
LPDDR4_A2_A: U1.1C1(AC15) U2.H9(CA2_A)
LPDDR4_A2_B: U1.1B7(AC18) U2.R9(CA2_B)
LPDDR4_A3_A: U1.1B3(AC12) U2.H10(CA3_A)
LPDDR4_A3_B: U1.1B6(AC4) U2.R10(CA3_B)
LPDDR4_A4_A: U1.1B1(AC14) U2.H11(CA4_A)
LPDDR4_A4_B: U1.1A6(AC19) U2.R11(CA4_B)
LPDDR4_A5_A: U1.1A1(AC16) U2.J11(CA5_A)
LPDDR4_A5_B: U1.B8(AC5) U2.P11(CA5_B)
LPDDR4_CKE0_A: U1.B4(AC22) U2.J4(CKE0_A)
LPDDR4_CKE0_B: U1.1A3(AC10) U2.P4(CKE0_B)
LPDDR4_CKE1_A: U1.1C3(AC3) U2.J5(CKE1_A)
LPDDR4_CKE1_B: U1.1A2(AC17) U2.P5(CKE1_B)
LPDDR4_CLKN_A: U1.B5(AC24) U2.J9(CK_c_A)
LPDDR4_CLKN_B: U1.B7(AC9) U2.P9(CK_c_B)
LPDDR4_CLKP_A: U1.A5(AC23) U2.J8(CK_t_A)
LPDDR4_CLKP_B: U1.A7(AC0) U2.P8(CK_t_B)
LPDDR4_CS0N_A: U1.B3(AC25) U2.H4(CS0_A)
LPDDR4_CS0N_B: U1.1B5(AC28) U2.R4(CS0_B)
LPDDR4_CS1N_A: U1.A3(AC26) U2.H3(CS1_A)
LPDDR4_CS1N_B: U1.1A5(AC27) U2.R3(CS1_B)
LPDDR4_ODT0_CA_A: U1.E2(AC8) U2.G2(ODT_CA_A)
LPDDR4_ODT0_CA_B: U1.A10(AC7) U2.T2(ODT_CA_B)
LPDDR4_RESETN: U1.1C7(AC29) U2.T11(RESET_n)
NetR10_2: R10.2 U2.A5(ZQ0)
NetR11_2: R11.2 U2.A8(ZQ1)
NetR12_2: R12.2 U1.1F3(DDR_RZQ)

Not connected (* = marked no-connect by the designer): U1 1A4(AC20)* 1C2(AC21)* 1D2(AC1)* 1H3(DDR_VREFOUT)*; U2 A1(DNU)* A2(DNU)* A11(DNU)* A12(DNU)* AA1(DNU)* AA12(DNU)* AB1(DNU)* AB2(DNU)* AB11(DNU)* AB12(DNU)* B1(DNU)* B12(DNU)* G11(NC)* K5(NC)* K8(NC)* N5(NC)* N8(NC)*

### Notes on the sheet
- 创建日期
- 2026-10-04
- 原理图
- 板子
- Schematic1
- Board1
- 更新日期
- 图页
- P2
- 绘制
- 审阅
- RK3566
- 版本
- V1.0
- 尺寸
- A4
- 页    6    共    6
- 嘉立创EDA

### Library data of the parts
C7 C15 C36 = HGC0603R5226M100NTHJ: 容值:22uF;精度:±20%;额定电压:10V;温度系数:X5R;; Manufacturer: Chinocera(华瓷); 3D Model: ac125912035d415993ca9572d50418b1聨0819f05c4eef4c71ace90d822a990e87; 3D Model Transform: 62.992,31.496,0,0,0,0,0,0,0; Tolerance: ±20%; Voltage Rating: 10V; Temperature Coefficient: X5R; AddInBom: yes; ModelName: C0603_L1.6-W0.8-H0.8; Symbol: HGC0603R5226M100NTHJ; Device: HGC0603R5226M100NTHJ; LCSC Part Name: 22uF ±20% 10V; Supplier Part: C7432770; Manufacturer Part: HGC0603R5226M100NTHJ; Supplier Footprint: 0603; JLCPCB Part Class: Extended Part; Datasheet: https://item.szlcsc.com/datasheet/HGC0603R5226M100NTHJ/8438252.html; Supplier: LCSC; Value: 22uF; ConvertToPcb: yes; FootprintName: C0603
C8 C9 C16-C19 C37-C40 = HGC0402R5106M100NTEJ: 容值:10uF;精度:±20%;额定电压:10V;温度系数:X5R;; Manufacturer: Chinocera(华瓷); 3D Model: 36a51122f27c49738f86b3bfa98863e0聨0819f05c4eef4c71ace90d822a990e87; 3D Model Transform: 39.37,19.685,0,0,0,0,0,0,0; Tolerance: ±20%; Voltage Rating: 10V; Temperature Coefficient: X5R; AddInBom: yes; ModelName: C0402_L1.0-W0.5-H0.5; Symbol: HGC0402R5106M100NTEJ; Device: HGC0402R5106M100NTEJ; LCSC Part Name: 10uF ±20% 10V; Supplier Part: C7472949; Manufacturer Part: HGC0402R5106M100NTEJ; Supplier Footprint: 0402; JLCPCB Part Class: Extended Part; Datasheet: https://item.szlcsc.com/datasheet/HGC0402R5106M100NTEJ/8532796.html; Supplier: LCSC; Value: 10uF; ConvertToPcb: yes; FootprintName: C0402
C10-C14 C20-C35 C41-C56 = CL05B104KO5NNNC: as C1 on sheet HDMI PHY _ IO1; Symbol: CL05B104KO5NNNC; Device: CL05B104KO5NNNC; LCSC Part Name: 100nF ±10% 16V; Supplier Part: C1525; Manufacturer Part: CL05B104KO5NNNC; Supplier Footprint: 0402; JLCPCB Part Class: Basic Part; Datasheet: https://item.szlcsc.com/datasheet/CL05B104KO5NNNC/1877.html; Supplier: LCSC; Value: 100nF; ConvertToPcb: yes; FootprintName: C0402
C57-C59 C62-C64 = GRM033R61E104KE14D: 容值:100nF;精度:±10%;额定电压:25V;温度系数:X5R;; Manufacturer: muRata(村田); AddInBom: yes; ModelId: e8033a7cb35143ffb28e3b81b2577ea0聨0819f05c4eef4c71ace90d822a990e87; ModelName: C0201_L0.6-W0.3-H0.3; ModelTransform: 23.622,11.811,0,0,0,0,0,0,0; Tolerance: ±10%; Voltage Rating: 25V; Temperature Coefficient: X5R; Symbol: GRM033R61E104KE14D; Device: GRM033R61E104KE14D; LCSC Part Name: 100nF ±10% 25V; SupplierPart: C76939; ManufacturerPart: GRM033R61E104KE14D; Supplier Footprint: 0201; JLCPCB Part Class: Extended Part; Datasheet: https://item.szlcsc.com/datasheet/GRM033R61E104KE14D/78066.html; Supplier: LCSC; ConvertToPcb: yes; FootprintName: C0201; Value: 100nF
C60 C61 C65 = CGA0402X5R475M250GT: 容值:4.7uF;精度:±20%;额定电压:25V;温度系数:X5R;; Manufacturer: HRE(芯声); 3D Model: 36a51122f27c49738f86b3bfa98863e0聨0819f05c4eef4c71ace90d822a990e87; 3D Model Transform: 39.37,19.685,0,0,0,0,0,0,0; Tolerance: ±20%; Voltage Rating: 25V; Temperature Coefficient: X5R; AddInBom: yes; ModelName: C0402_L1.0-W0.5-H0.5; Symbol: CGA0402X5R475M250GT; Device: CGA0402X5R475M250GT; LCSC Part Name: 4.7uF ±20% 25V; Supplier Part: C6119795; Manufacturer Part: CGA0402X5R475M250GT; Supplier Footprint: 0402; JLCPCB Part Class: Extended Part; Datasheet: https://item.szlcsc.com/datasheet/CGA0402X5R475M250GT/7062501.html; Supplier: LCSC; Value: 4.7uF; ConvertToPcb: yes; FootprintName: C0402
C66 = CGA0603X5R106K100JT: 容值:10uF;精度:±10%;额定电压:10V;温度系数:X5R;; Manufacturer: HRE(芯声); AddInBom: yes; ModelId: ac125912035d415993ca9572d50418b1聨0819f05c4eef4c71ace90d822a990e87; ModelName: C0603_L1.6-W0.8-H0.8; ModelTransform: 62.992,31.496,0,0,0,0,0,0,0; Tolerance: ±10%; Voltage Rating: 10V; Temperature Coefficient: X5R; Symbol: CGA0603X5R106K100JT; Device: CGA0603X5R106K100JT; LCSC Part Name: 10uF ±10% 10V; SupplierPart: C6119842; ManufacturerPart: CGA0603X5R106K100JT; Supplier Footprint: 0603; JLCPCB Part Class: Extended Part; Datasheet: https://item.szlcsc.com/datasheet/CGA0603X5R106K100JT/7062548.html; Supplier: LCSC; ConvertToPcb: yes; FootprintName: C0603; Value: 10uF
R10-R12 = FRC0402F2400TS: 电阻类型:厚膜电阻;阻值:240Ω;精度:±1%;功率:62.5mW;工作电压:50V;温度系数:±100ppm/℃;; Manufacturer: FOJAN(富捷); AddInBom: yes; ModelId: 98c88bc2b9094f218f3a3e30a7012738聨0819f05c4eef4c71ace90d822a990e87; ModelName: R0402_L1.0-W0.5-H0.4; ModelTransform: 39.37,19.685,0,0,0,0,0,0,0; Tolerance: ±1%; Power(Watts): 62.5mW; Voltage-Supply(Max): 50V; Symbol: FRC0402F2400TS; Device: FRC0402F2400TS; LCSC Part Name: 240Ω ±1% 62.5mW 厚膜电阻; SupplierPart: C2909339; ManufacturerPart: FRC0402F2400TS; Supplier Footprint: 0402; JLCPCB Part Class: Extended Part; Datasheet: https://item.szlcsc.com/datasheet/FRC0402F2400TS/3186274.html; Supplier: LCSC; ConvertToPcb: yes; FootprintName: R0402; Type: 厚膜电阻; Value: 240Ω; Temperature Coefficient: ±100ppm/℃; Operating Temperature: -55℃~+155℃
U1 = RK3566: as U1 on sheet HDMI PHY _ IO1; Symbol: RK3566; Device: RK3566; LCSC Part Name: 表面贴装型开关全行程、动作力等性能; Supplier Part: C2943786; Manufacturer Part: RK3566; Supplier Footprint: BGA-565(15.5x14.4); JLCPCB Part Class: Extended Part; Datasheet: https://item.szlcsc.com/datasheet/RK3566/3329057.html; Supplier: LCSC; ConvertToPcb: yes; FootprintName: BGA-565_L15.5-W14.4-P0.40_RK3566_1; ModelName: BGA-565_L15.5-W14.4-P0.40_RK3566_1
U2 = MT53D1024M32D4DT-046 WT:D_C22437471: 存储器构架(格式):LPDDR4 SDRAM;时钟频率(fc):2.133GHz;存储容量:32Gbit;; Manufacturer: micron(美光); Relevance: []; AddInBom: yes; Memory Size: 32Gbit; Voltage - Supply: 1.1V; Symbol: MT53D1024M32D4DT-046 WT:D_C22437471; Device: MT53D1024M32D4DT-046 WT:D_C22437471; LCSC Part Name: X32 LPDDR4/LPDDR4X SDRAM; SupplierPart: C22437471; ManufacturerPart: MT53D1024M32D4DT-046 WT:D; Supplier Footprint: VFBGA-200(10x14.5); JLCPCB Part Class: Extended Part; Datasheet: https://item.szlcsc.com/datasheet/MT53D1024M32D4DT-046%2520WT%253AD/24072754.html; Supplier: LCSC; ConvertToPcb: yes; FootprintName: VFBGA-200_L14.5-W10.0-BL_MT53D1024M32D4DT; Memory Format: LPDDR4 SDRAM; Clock Frequency: 2.133GHz; Current - Supply: -; Refresh Current: -; Operating Temperature: -30℃~+85℃; Features: 写入均衡功能；自动自刷新；内置温度传感器；自动预充电功能；ZQ校准功能

## Sheet PMUIO _ VCCIO.schdoc
size 297 x 209 mm; Symbol: Drawing-Symbol_A4; Company: 嘉立创EDA; Version: V1.0; Page Size: A4; @Project Name: RK3566; @Update Date: 2026-09-30; @Create Date: 2026-05-20; Device: Drawing-Symbol_A4; @Board Name: Board1; @Page Name: P1; @Create Time: 01:20:11; @Page Count: 2; @Page No: 2; @Schematic Name: Schematic1; @Update Time: 01:20:11; @Assembly Variant: Basic; Border: 1; Title Block Position: 3; Size: A4; Width: 1170; Height: 825; Region Start: 1; X Region Count: 6; Y Region Count: 4; Blade Width: 10; SheetNumber: 3; SheetTotal: 11
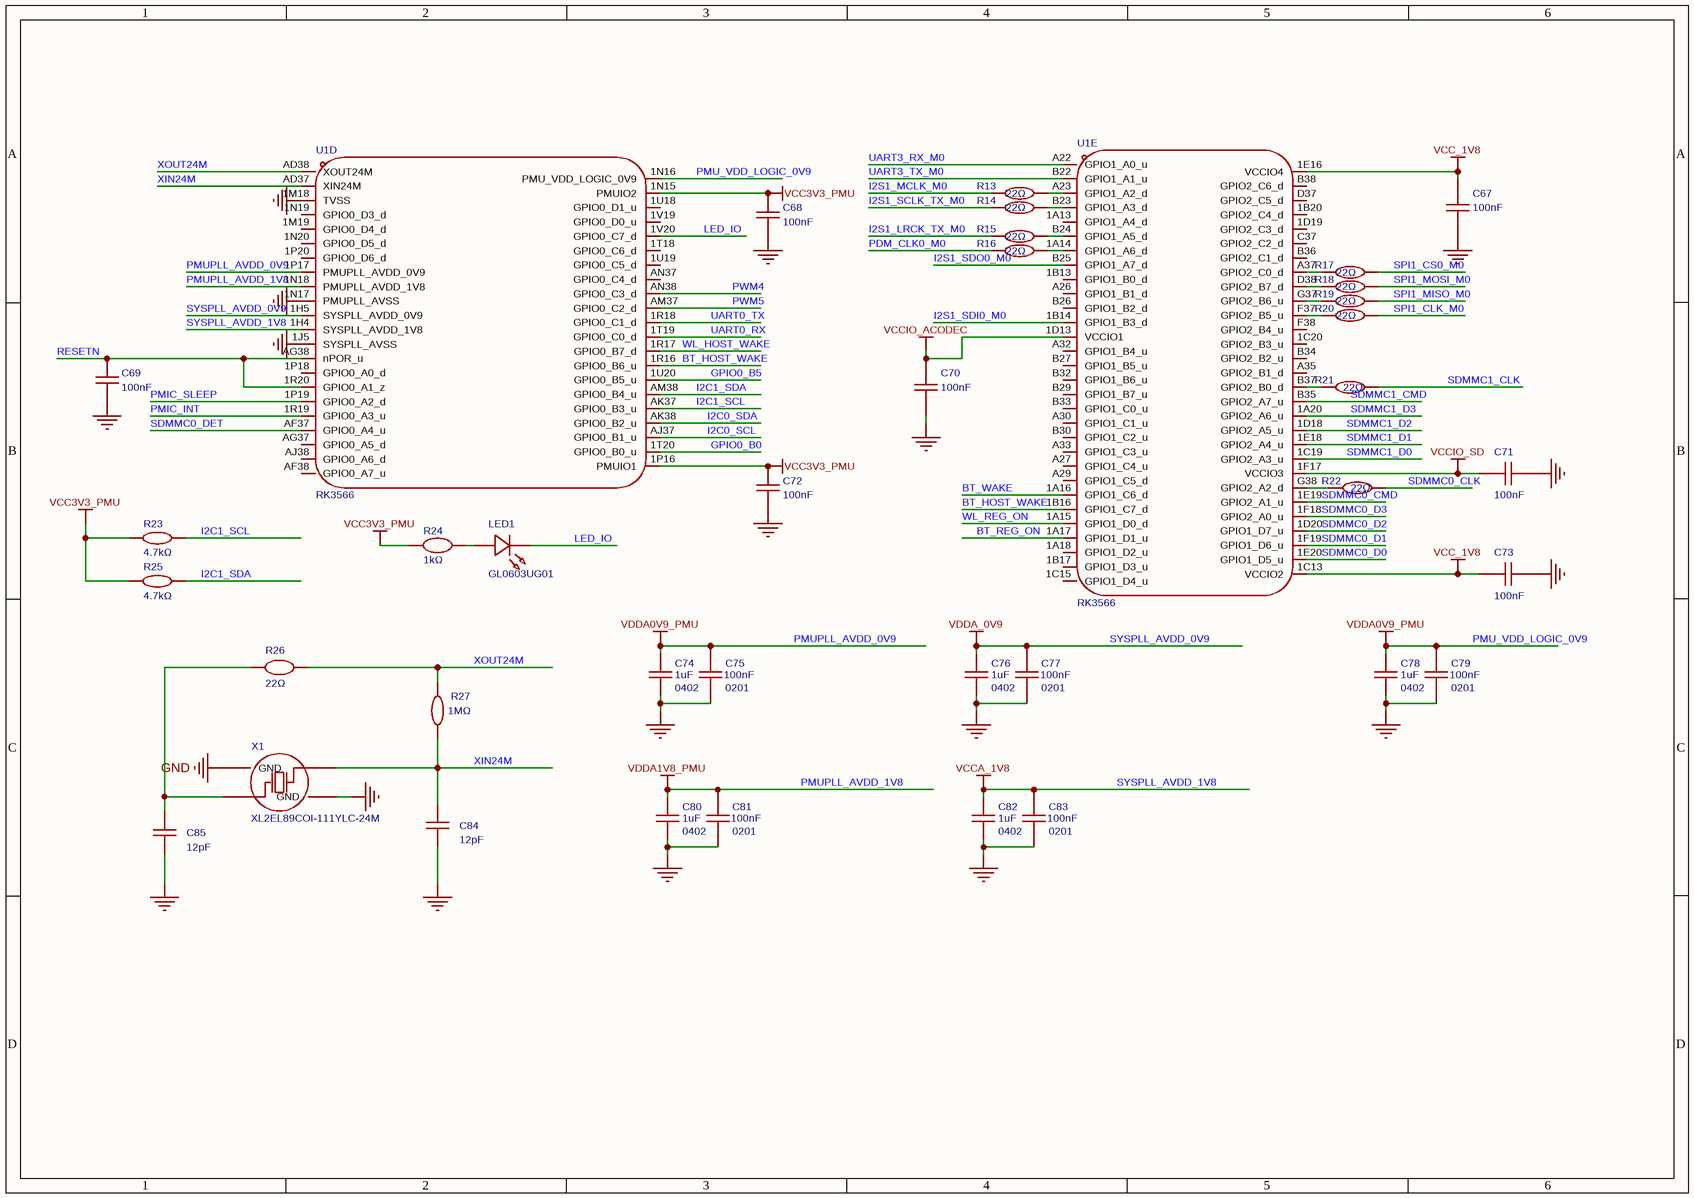
[diagram p2: PMUIO _ VCCIO.schdoc]

### Parts
C67  100nF  [C0201]
C68  100nF  [C0201]
C69  100nF  [C0201]
C70  100nF  [C0201]
C71  100nF  [C0201]
C72  100nF  [C0201]
C73  100nF  [C0201]
C74  1uF  Supplier Footprint: 0402  [C0402]
C75  100nF  Supplier Footprint: 0201  [C0201]
C76  1uF  Supplier Footprint: 0402  [C0402]
C77  100nF  Supplier Footprint: 0201  [C0201]
C78  1uF  Supplier Footprint: 0402  [C0402]
C79  100nF  Supplier Footprint: 0201  [C0201]
C80  1uF  Supplier Footprint: 0402  [C0402]
C81  100nF  Supplier Footprint: 0201  [C0201]
C82  1uF  Supplier Footprint: 0402  [C0402]
C83  100nF  Supplier Footprint: 0201  [C0201]
C84  12pF  [C0402]
C85  12pF  [C0402]
LED1  GL0603UG01  [LED0603-RD]
R13  22Ω  [R0402]
R14  22Ω  [R0402]
R15  22Ω  [R0402]
R16  22Ω  [R0402]
R17  22Ω  [R0402]
R18  22Ω  [R0402]
R19  22Ω  [R0402]
R20  22Ω  [R0402]
R21  22Ω  [R0402]
R22  22Ω  [R0402]
R23  4.7kΩ  [R0402]
R24  1kΩ  [R0603]
R25  4.7kΩ  [R0402]
R26  22Ω  [R0402]
R27  1MΩ  [R0402]
U1  RK3566  [BGA-565_L15.5-W14.4-P0.40_RK3566_1]  (parts D,E of 8)
X1  XL2EL89COI-111YLC-24M  [OSC-SMD_4P-L3.2-W2.5-BL]

### Nets
GND: C67.1 C68.1 C69.1 C70.1 C71.1 C72.1 C73.1 C74.1 C75.1 C76.1 C77.1 C78.1 C79.1 C80.1 C81.1 C82.1 C83.1 C84.1 C85.1 U1.1J5(SYSPLL_AVSS) U1.1M18(TVSS) U1.1N17(PMUPLL_AVSS) X1.2(GND) X1.4(GND)  [project net AVSS1_1]
PMU_VDD_LOGIC_0V9: C74.2 C75.2 C78.2 C79.2 U1.1N16(PMU_VDD_LOGIC_0V9) U1.1P17(PMUPLL_AVDD_0V9)  [also labelled PMUPLL_AVDD_0V9, VDDA0V9_PMU]  [project net LDO3]
PMUPLL_AVDD_1V8: C80.2 C81.2 U1.1N18(PMUPLL_AVDD_1V8)  [also labelled VDDA1V8_PMU]
SYSPLL_AVDD_0V9: C76.2 C77.2 U1.1H5(SYSPLL_AVDD_0V9)  [also labelled VDDA_0V9]  [project net LDO2]
SYSPLL_AVDD_1V8: C82.2 C83.2 U1.1H4(SYSPLL_AVDD_1V8)  [also labelled VCCA_1V8]  [project net LDO7]
VCC3V3_PMU: C68.2 C72.2 R23.1 R24.1 R25.1 U1.1N15(PMUIO2) U1.1P16(PMUIO1)  [project net LDO6]
VCC_1V8: C67.2 C73.2 U1.1C13(VCCIO2) U1.1E16(VCCIO4)
VCCIO_ACODEC: C70.2 U1.1D13(VCCIO1)  [project net LDO4]
VCCIO_SD: C71.2 U1.1F17(VCCIO3)  [project net LDO5]
BT_HOST_WAKE: U1.1B16(GPIO1_C7_d) U1.1R16(GPIO0_B6_u)
BT_REG_ON: U1.1A17(GPIO1_D1_u)
BT_WAKE: U1.1A16(GPIO1_C6_d)
GPIO0_B0: U1.1T20(GPIO0_B0_u)
GPIO0_B5: U1.1U20(GPIO0_B5_u)
I2C0_SCL: U1.AJ37(GPIO0_B1_u)
I2C0_SDA: U1.AK38(GPIO0_B2_u)
I2C1_SCL: R23.2 U1.AK37(GPIO0_B3_u)
I2C1_SDA: R25.2 U1.AM38(GPIO0_B4_u)
I2S1_LRCK_TX_M0: R15.1
I2S1_MCLK_M0: R13.1
I2S1_SCLK_TX_M0: R14.1
I2S1_SDI0_M0: U1.1B14(GPIO1_B3_d)
I2S1_SDO0_M0: U1.B25(GPIO1_A7_d)
LED_IO: LED1.1(K) U1.1V20(GPIO0_C7_d)
PDM_CLK0_M0: R16.1
PMIC_INT: U1.1R19(GPIO0_A3_u)
PMIC_SLEEP: U1.1P19(GPIO0_A2_d)
PWM4: U1.AN38(GPIO0_C3_d)
PWM5: U1.AM37(GPIO0_C2_d)
RESETN: C69.2 U1.1R20(GPIO0_A1_z) U1.AG38(nPOR_u)
SDMMC0_CLK: R22.2
SDMMC0_CMD: U1.1E19(GPIO2_A1_u)
SDMMC0_D0: U1.1E20(GPIO1_D5_u)
SDMMC0_D1: U1.1F19(GPIO1_D6_u)
SDMMC0_D2: U1.1D20(GPIO1_D7_u)
SDMMC0_D3: U1.1F18(GPIO2_A0_u)
SDMMC0_DET: U1.AF37(GPIO0_A4_u)
SDMMC1_CLK: R21.2
SDMMC1_CMD: U1.B35(GPIO2_A7_u)
SDMMC1_D0: U1.1C19(GPIO2_A3_u)
SDMMC1_D1: U1.1E18(GPIO2_A4_u)
SDMMC1_D2: U1.1D18(GPIO2_A5_u)
SDMMC1_D3: U1.1A20(GPIO2_A6_u)
SPI1_CLK_M0: R20.2
SPI1_CS0_M0: R17.2
SPI1_MISO_M0: R19.2
SPI1_MOSI_M0: R18.2
UART0_RX: U1.1T19(GPIO0_C0_d)
UART0_TX: U1.1R18(GPIO0_C1_d)
UART3_RX_M0: U1.A22(GPIO1_A0_u)
UART3_TX_M0: U1.B22(GPIO1_A1_u)
WL_HOST_WAKE: U1.1R17(GPIO0_B7_d)
WL_REG_ON: U1.1A15(GPIO1_D0_d)
XIN24M: C84.2 R27.1 U1.AD37(XIN24M) X1.3(OSC2)
XOUT24M: R26.2 R27.2 U1.AD38(XOUT24M)
NetC85_2: C85.2 R26.1 X1.1(OSC1)
NetLED1_2: LED1.2(A) R24.2
NetR13_2: R13.2 U1.A23(GPIO1_A2_d)
NetR14_2: R14.2 U1.B23(GPIO1_A3_d)
NetR15_2: R15.2 U1.B24(GPIO1_A5_d)
NetR16_2: R16.2 U1.1A14(GPIO1_A6_d)
NetR17_1: R17.1 U1.A37(GPIO2_C0_d)
NetR18_1: R18.1 U1.D38(GPIO2_B7_d)
NetR19_1: R19.1 U1.G37(GPIO2_B6_u)
NetR20_1: R20.1 U1.F37(GPIO2_B5_u)
NetR21_1: R21.1 U1.B37(GPIO2_B0_d)
NetR22_1: R22.1 U1.G38(GPIO2_A2_d)

Not connected (* = marked no-connect by the designer): U1 1A13(GPIO1_A4_d) 1A18(GPIO1_D2_u) 1B13(GPIO1_B0_d) 1B17(GPIO1_D3_u) 1B20(GPIO2_C4_d) 1C15(GPIO1_D4_u) 1C20(GPIO2_B3_u) 1D19(GPIO2_C3_d) 1M19(GPIO0_D4_d) 1N19(GPIO0_D3_d) 1N20(GPIO0_D5_d) 1P18(GPIO0_A0_d) 1P20(GPIO0_D6_d) 1T18(GPIO0_C6_d) 1U18(GPIO0_D1_u) 1U19(GPIO0_C5_d) 1V19(GPIO0_D0_u) A26(GPIO1_B1_d) A27(GPIO1_C4_u) A29(GPIO1_C5_d) A30(GPIO1_C1_u) A32(GPIO1_B4_u) A33(GPIO1_C3_u) A35(GPIO2_B1_d) AF38(GPIO0_A7_u) AG37(GPIO0_A5_d) AJ38(GPIO0_A6_d) AN37(GPIO0_C4_d) B26(GPIO1_B2_d) B27(GPIO1_B5_u) B29(GPIO1_B7_u) B30(GPIO1_C2_u) B32(GPIO1_B6_u) B33(GPIO1_C0_u) B34(GPIO2_B2_u) B36(GPIO2_C1_d) B38(GPIO2_C6_d) C37(GPIO2_C2_d) D37(GPIO2_C5_d) F38(GPIO2_B4_u)

### Notes on the sheet
- 创建日期
- 2026-09-30
- 原理图
- 板子
- Schematic1
- Board1
- 更新日期
- 图页
- P1
- 绘制
- 审阅
- RK3566
- 版本
- V1.0
- 尺寸
- A4
- 页    2    共    2
- 嘉立创EDA

### Library data of the parts
C67 C70 C71 C73 C75 C77 C79 C81 C83 = CL03A104KO3NNNC: 容值:100nF;精度:±10%;额定电压:16V;材质(温度系数):X5R;; Manufacturer: SAMSUNG(三星); Symbol: CL05B104KB54PNC; 3D Model: e8033a7cb35143ffb28e3b81b2577ea0; 3D Model Transform: 23.622,11.811,0,0,0,0,0,0,0; Tolerance: ±10%; Voltage Rated: 16V; Temperature Coefficient: X5R; AddInBom: yes; ModelName: C0201_L0.6-W0.3-H0.3; Device: CL03A104KO3NNNC; JLCPCB Part Class: Extended Part; LCSC Part Name: 100nF ±10% 16V; Supplier Part: C307380; Manufacturer Part: CL03A104KO3NNNC; Datasheet: https://atta.szlcsc.com/upload/public/pdf/source/20181009/C307380_E0679AAF9658ADA26DBF30CED0CA6925.pdf; Supplier: LCSC; Value: 100nF; ConvertToPcb: yes; FootprintName: C0201
  C67 C70 C71 C73: Supplier Footprint: 0201
C68 C69 C72 = GRM033R61E104KE14D: 容值:100nF;精度:±10%;额定电压:25V;温度系数:X5R;; Manufacturer: muRata(村田); 3D Model: e8033a7cb35143ffb28e3b81b2577ea0聨0819f05c4eef4c71ace90d822a990e87; 3D Model Transform: 23.622,11.811,0,0,0,0,0,0,0; Tolerance: ±10%; Voltage Rating: 25V; Temperature Coefficient: X5R; AddInBom: yes; ModelName: C0201_L0.6-W0.3-H0.3; Symbol: GRM033R61E104KE14D; Device: GRM033R61E104KE14D; LCSC Part Name: 100nF ±10% 25V; Supplier Part: C76939; Manufacturer Part: GRM033R61E104KE14D; Supplier Footprint: 0201; JLCPCB Part Class: Extended Part; Datasheet: https://item.szlcsc.com/datasheet/GRM033R61E104KE14D/78066.html; Supplier: LCSC; Value: 100nF; ConvertToPcb: yes; FootprintName: C0201
C74 C76 C78 C80 C82 = CL05A105KP5NNNC: 容值:1uF;精度:±10%;额定电压:10V;材质(温度系数):X5R;; Manufacturer: SAMSUNG(三星); 3D Model: 36a51122f27c49738f86b3bfa98863e0; 3D Model Transform: 39.37,19.685,0,0,0,0,0,0,0; Tolerance: ±10%; Voltage Rated: 10V; Temperature Coefficient: X5R; AddInBom: yes; ModelName: C0402_L1.0-W0.5-H0.5; Symbol: CL05A105KP5NNNC; Device: CL05A105KP5NNNC; LCSC Part Name: 1uF ±10% 10V; Supplier Part: C14445; Manufacturer Part: CL05A105KP5NNNC; JLCPCB Part Class: 扩展库; Datasheet: https://atta.szlcsc.com/upload/public/pdf/source/20160103/1457707670698.pdf; Supplier: LCSC; Value: 1uF; ConvertToPcb: yes; FootprintName: C0402
C84 C85 = CC0402JRNPO9BN120: 容值:12pF;精度:±5%;额定电压:50V;温度系数:NP0;; Manufacturer: YAGEO(国巨); AddInBom: yes; ModelId: 36a51122f27c49738f86b3bfa98863e0聨0819f05c4eef4c71ace90d822a990e87; ModelName: C0402_L1.0-W0.5-H0.5; ModelTransform: 39.37,19.685,0,0,0,0,0,0,0; Tolerance: ±5%; Voltage Rating: 50V; Temperature Coefficient: NP0; Symbol: CC0402JRNPO9BN120; Device: CC0402JRNPO9BN120; LCSC Part Name: 12pF ±5% 50V; SupplierPart: C106201; ManufacturerPart: CC0402JRNPO9BN120; Supplier Footprint: 0402; JLCPCB Part Class: Extended Part; Datasheet: https://item.szlcsc.com/datasheet/CC0402JRNPO9BN120/107416.html; Supplier: LCSC; ConvertToPcb: yes; FootprintName: C0402; Value: 12pF
LED1 = GL0603UG01: 灯头类型:-;发光颜色:翠绿色;正向压降(Vf):2.7V~3.2V;功率:-;测试电流:20mA;波长:510nm~531nm;二极管配置:独立二极管;透镜颜色:无色透明透镜;色温:-;发光强度:173mcd~350mcd;发光角度:120°;载带方式:正贴;工作温度:-40℃~+85℃;; Manufacturer: Guiguang light(桂光光电); AddInBom: yes; ModelId: 1f0d29a91be547639d425604e9b96ebb聨0819f05c4eef4c71ace90d822a990e87; ModelTransform: 63.7794,32.283,0,0,0,0,0,0,0; Illumination Color: 翠绿色; Test Current: 20mA; Diode Configuration: 独立二极管; Lens Color: 无色透明透镜; Viewing Angle: 120°; Symbol: GL0603UG01; Device: GL0603UG01; LCSC Part Name: 0603 翠绿 高亮; SupplierPart: C51933293; ManufacturerPart: GL0603UG01; Supplier Footprint: 0603; JLCPCB Part Class: Extended Part; Datasheet: https://item.szlcsc.com/datasheet/GL0603UG01/54645989.html; Supplier: LCSC; ConvertToPcb: yes; FootprintName: LED0603-RD; ModelName: LED0603-RD; Lamp Holder Type: -; Voltage - Forward(Vf): 2.7V~3.2V; Power(Watts): -; Wavelength - Dominant: 510nm~531nm; Peak Wavelength: -; Color Temperature: -; Luminous Intensity: 173mcd~350mcd; Mounting Style: 正贴; Operating Temperature: -40℃~+85℃
R13-R16 = 0402WGF220JTCE: 电阻类型:厚膜电阻;阻值:22Ω;精度:±1%;功率:62.5mW;最大工作电压:50V;温度系数:±100ppm/℃;; Manufacturer: UNI-ROYAL(厚声); AddInBom: yes; ModelId: 98c88bc2b9094f218f3a3e30a7012738聨0819f05c4eef4c71ace90d822a990e87; ModelName: R0402_L1.0-W0.5-H0.4; ModelTransform: 39.37,19.685,0,0,0,0,0,0,0; Tolerance: ±1%; Power(Watts): 62.5mW; Overload Voltage (Max): 50V; Symbol: 0402WGF220JTCE; Device: 0402WGF220JTCE; LCSC Part Name: 22Ω ±1% 62.5mW 厚膜电阻; SupplierPart: C25092; ManufacturerPart: 0402WGF220JTCE; Supplier Footprint: 0402; JLCPCB Part Class: Basic Part; Datasheet: https://atta.szlcsc.com/upload/public/pdf/source/20200306/C422600_1E6D84923E4A46A82E41ADD87F860B5C.pdf; Supplier: LCSC; ConvertToPcb: yes; FootprintName: R0402; Type: 厚膜电阻; Value: 22Ω; Temperature Coefficient: ±100ppm/℃; Operating Temperature Range: -55℃~+155℃
R17-R22 = RC0402FR-0722RL: 电阻类型:厚膜电阻;阻值:22Ω;精度:±1%;功率:62.5mW;工作电压:50V;温度系数:±100ppm/℃;; Manufacturer: YAGEO(国巨); 3D Model: 98c88bc2b9094f218f3a3e30a7012738聨0819f05c4eef4c71ace90d822a990e87; 3D Model Transform: 39.37,19.685,0,0,0,0,0,0,0; Tolerance: ±1%; Power(Watts): 62.5mW; Voltage-Supply(Max): 50V; AddInBom: yes; ModelName: R0402_L1.0-W0.5-H0.4; Symbol: RC0402FR-0722RL; Device: RC0402FR-0722RL; LCSC Part Name: 厚膜电阻 22Ω ±1% 62.5mW; Supplier Part: C114765; Manufacturer Part: RC0402FR-0722RL; Supplier Footprint: 0402; JLCPCB Part Class: Extended Part; Datasheet: https://item.szlcsc.com/datasheet/RC0402FR-0722RL/116009.html; Supplier: LCSC; Type: 厚膜电阻; Value: 22Ω; Temperature Coefficient: ±100ppm/℃; Operating Temperature: -55℃~+155℃; ConvertToPcb: yes; FootprintName: R0402
R23 R25 = RC0402FR-074K7L: 电阻类型:厚膜电阻;阻值:4.7kΩ;精度:±1%;功率:62.5mW;工作电压:50V;温度系数:±100ppm/℃;; Manufacturer: YAGEO(国巨); AddInBom: yes; ModelId: 98c88bc2b9094f218f3a3e30a7012738聨0819f05c4eef4c71ace90d822a990e87; ModelName: R0402_L1.0-W0.5-H0.4; ModelTransform: 39.37,19.685,0,0,0,0,0,0,0; Tolerance: ±1%; Power(Watts): 62.5mW; Voltage-Supply(Max): 50V; Symbol: RC0402FR-074K7L; Device: RC0402FR-074K7L; LCSC Part Name: 厚膜电阻 4.7kΩ ±1% 62.5mW; SupplierPart: C105871; ManufacturerPart: RC0402FR-074K7L; Supplier Footprint: 0402; JLCPCB Part Class: Extended Part; Datasheet: https://item.szlcsc.com/datasheet/RC0402FR-074K7L/107086.html; Supplier: LCSC; ConvertToPcb: yes; FootprintName: R0402; Type: 厚膜电阻; Value: 4.7kΩ; Temperature Coefficient: ±100ppm/℃; Operating Temperature: -55℃~+155℃
R24 = FRC0603F1001TS: 电阻类型:厚膜电阻;阻值:1kΩ;精度:±1%;功率:100mW;工作电压:75V;温度系数:±100ppm/℃;; Manufacturer: FOJAN(富捷); AddInBom: yes; ModelId: fc143cca1e79419f9cd78b61e9279f08聨0819f05c4eef4c71ace90d822a990e87; ModelTransform: 31.8897,63.7794,0,90,0,0,0,0,0; Tolerance: ±1%; Power(Watts): 100mW; Voltage-Supply(Max): 75V; Symbol: FRC0603F1001TS; Device: FRC0603F1001TS; LCSC Part Name: 1kΩ ±1% 100mW 厚膜电阻; SupplierPart: C2907002; ManufacturerPart: FRC0603F1001TS; Supplier Footprint: 0603; JLCPCB Part Class: Extended Part; Datasheet: https://item.szlcsc.com/datasheet/FRC0603F1001TS/3180515.html; Supplier: LCSC; ConvertToPcb: yes; FootprintName: R0603; ModelName: R0603; Type: 厚膜电阻; Value: 1kΩ; Temperature Coefficient: ±100ppm/℃; Operating Temperature: -55℃~+155℃
R26 = 0402WGF220JTCE: 电阻类型:厚膜电阻;阻值:22Ω;精度:±1%;功率:62.5mW;温度系数:±100ppm/℃;; Manufacturer: UNI-ROYAL(厚声); Symbol: ERJPA2F22R0X; 3D Model: 671aefced39d4c318694bba8bd8efd39; 3D Model Transform: 39.37,19.685,0,0,0,0,0,0.0005,0; Tolerance: ±1%; Power(Watts): 62.5mW; Overload Voltage (Max): 50V; AddInBom: yes; ModelName: R0402_L1.0-W0.5-H0.5; Device: 0402WGF220JTCE; LCSC Part Name: 厚膜电阻 22Ω ±1% 62.5mW; Supplier Part: C25092; Manufacturer Part: 0402WGF220JTCE; Supplier Footprint: 0402; JLCPCB Part Class: Basic Part; Datasheet: https://atta.szlcsc.com/upload/public/pdf/source/20200306/C422600_1E6D84923E4A46A82E41ADD87F860B5C.pdf; Supplier: LCSC; Type: 厚膜电阻; Value: 22Ω; Temperature Coefficient: ±100ppm/℃; Operating Temperature Range: -55℃~+155℃; ConvertToPcb: yes; FootprintName: R0402
R27 = RMC04021M5%N: 阻值:1MΩ;精度:±5%;功率:62.5mW;; Manufacturer: Tyohm(幸亚电阻); 3D Model: 671aefced39d4c318694bba8bd8efd39; 3D Model Transform: 39.37,19.685,0,0,0,0,0,0.0005,0; Tolerance: ±5%; Power(Watts): 62.5mW; AddInBom: yes; ModelName: R0402_L1.0-W0.5-H0.5; Symbol: RMC04021M5%N; Device: RMC04021M5%N; LCSC Part Name: 1MΩ ±5% 62.5mW; Supplier Part: C325525; Manufacturer Part: RMC04021M5%N; Supplier Footprint: 0402; JLCPCB Part Class: 扩展库; Datasheet: https://atta.szlcsc.com/upload/public/pdf/source/20190115/C325525_90ADED69DA9348756F9671214E48FF04.pdf; Supplier: LCSC; Value: 1MΩ; ConvertToPcb: yes; FootprintName: R0402
U1 = RK3566: 是一款高性能、低功耗的四核应用处理器，专为个人移动互联网设备和AIoT设备设计。提供了许多嵌入式强大硬件引擎，以优化高端应用的性能。支持几乎全格式的H.264 4K@60fps解码器、H.265 4K@60fps解码器，还支持H.264/H.265 1080p@60fps编码器、高质量JPEG编码器/解码器。嵌入式3D GPU使其完全兼容OpenGL ES 1.1/2.0/3.2、OpenCL 2.0和Vulkan 1.1; Manufacturer: Rockchip(瑞芯微); Relevance: []; AddInBom: yes; ModelId: 096be4498db445d8b521581a084e15ec聨0819f05c4eef4c71ace90d822a990e87; ModelTransform: 610.235,566.928,0,0,0,0,0,0,0; Symbol: RK3566; Device: RK3566; LCSC Part Name: 表面贴装型开关全行程、动作力等性能; SupplierPart: C2943786; ManufacturerPart: RK3566; Supplier Footprint: BGA-565(15.5x14.4); JLCPCB Part Class: Extended Part; Datasheet: https://item.szlcsc.com/datasheet/RK3566/3329057.html; Supplier: LCSC; ConvertToPcb: yes; FootprintName: BGA-565_L15.5-W14.4-P0.40_RK3566_1; ModelName: BGA-565_L15.5-W14.4-P0.40_RK3566_1
X1 = XL2EL89COI-111YLC-24M: 频率： 24MHZ 负载： 12PF 频率公差： ±10PPM 工作温度： -40~85℃; Manufacturer: YXC(扬兴晶振); Symbol: X1E000210127000G; Crystal Type: 贴片无源晶振; Load Capacitance: 9pF; Equivalent Series Resistance (ESR): 40Ω; 3D Model: ae22b8d143894765bc8100c37cb6356f; 3D Model Transform: 125.984,98.425,0,0,0,0,0,0,0; AddInBom: yes; ModelName: OSC-SMD_4P-L3.2-W2.5-H1.0; Device: XL2EL89COI-111YLC-24M; Datasheet: https://atta.szlcsc.com/upload/public/pdf/source/20161130/1480474612820.pdf; Operating Temperature: -40℃~+85℃; Value: 24MHz; Frequency Tolerance: ±10ppm; Frequency Stability: -; LCSC Part Name: 24MHZ 12PF ±10PPM YSX321SL; JLCPCB Part Class: Extended Part; Supplier Part: C5444545; Manufacturer Part: XL2EL89COI-111YLC-24M; Supplier Footprint: SMD3225-4P; Supplier: LCSC; ConvertToPcb: yes; FootprintName: OSC-SMD_4P-L3.2-W2.5-BL